# Altium schematic sheet Sheet3.SchDoc
size Tabloid; SheetNumber: 1; SheetTotal: 1
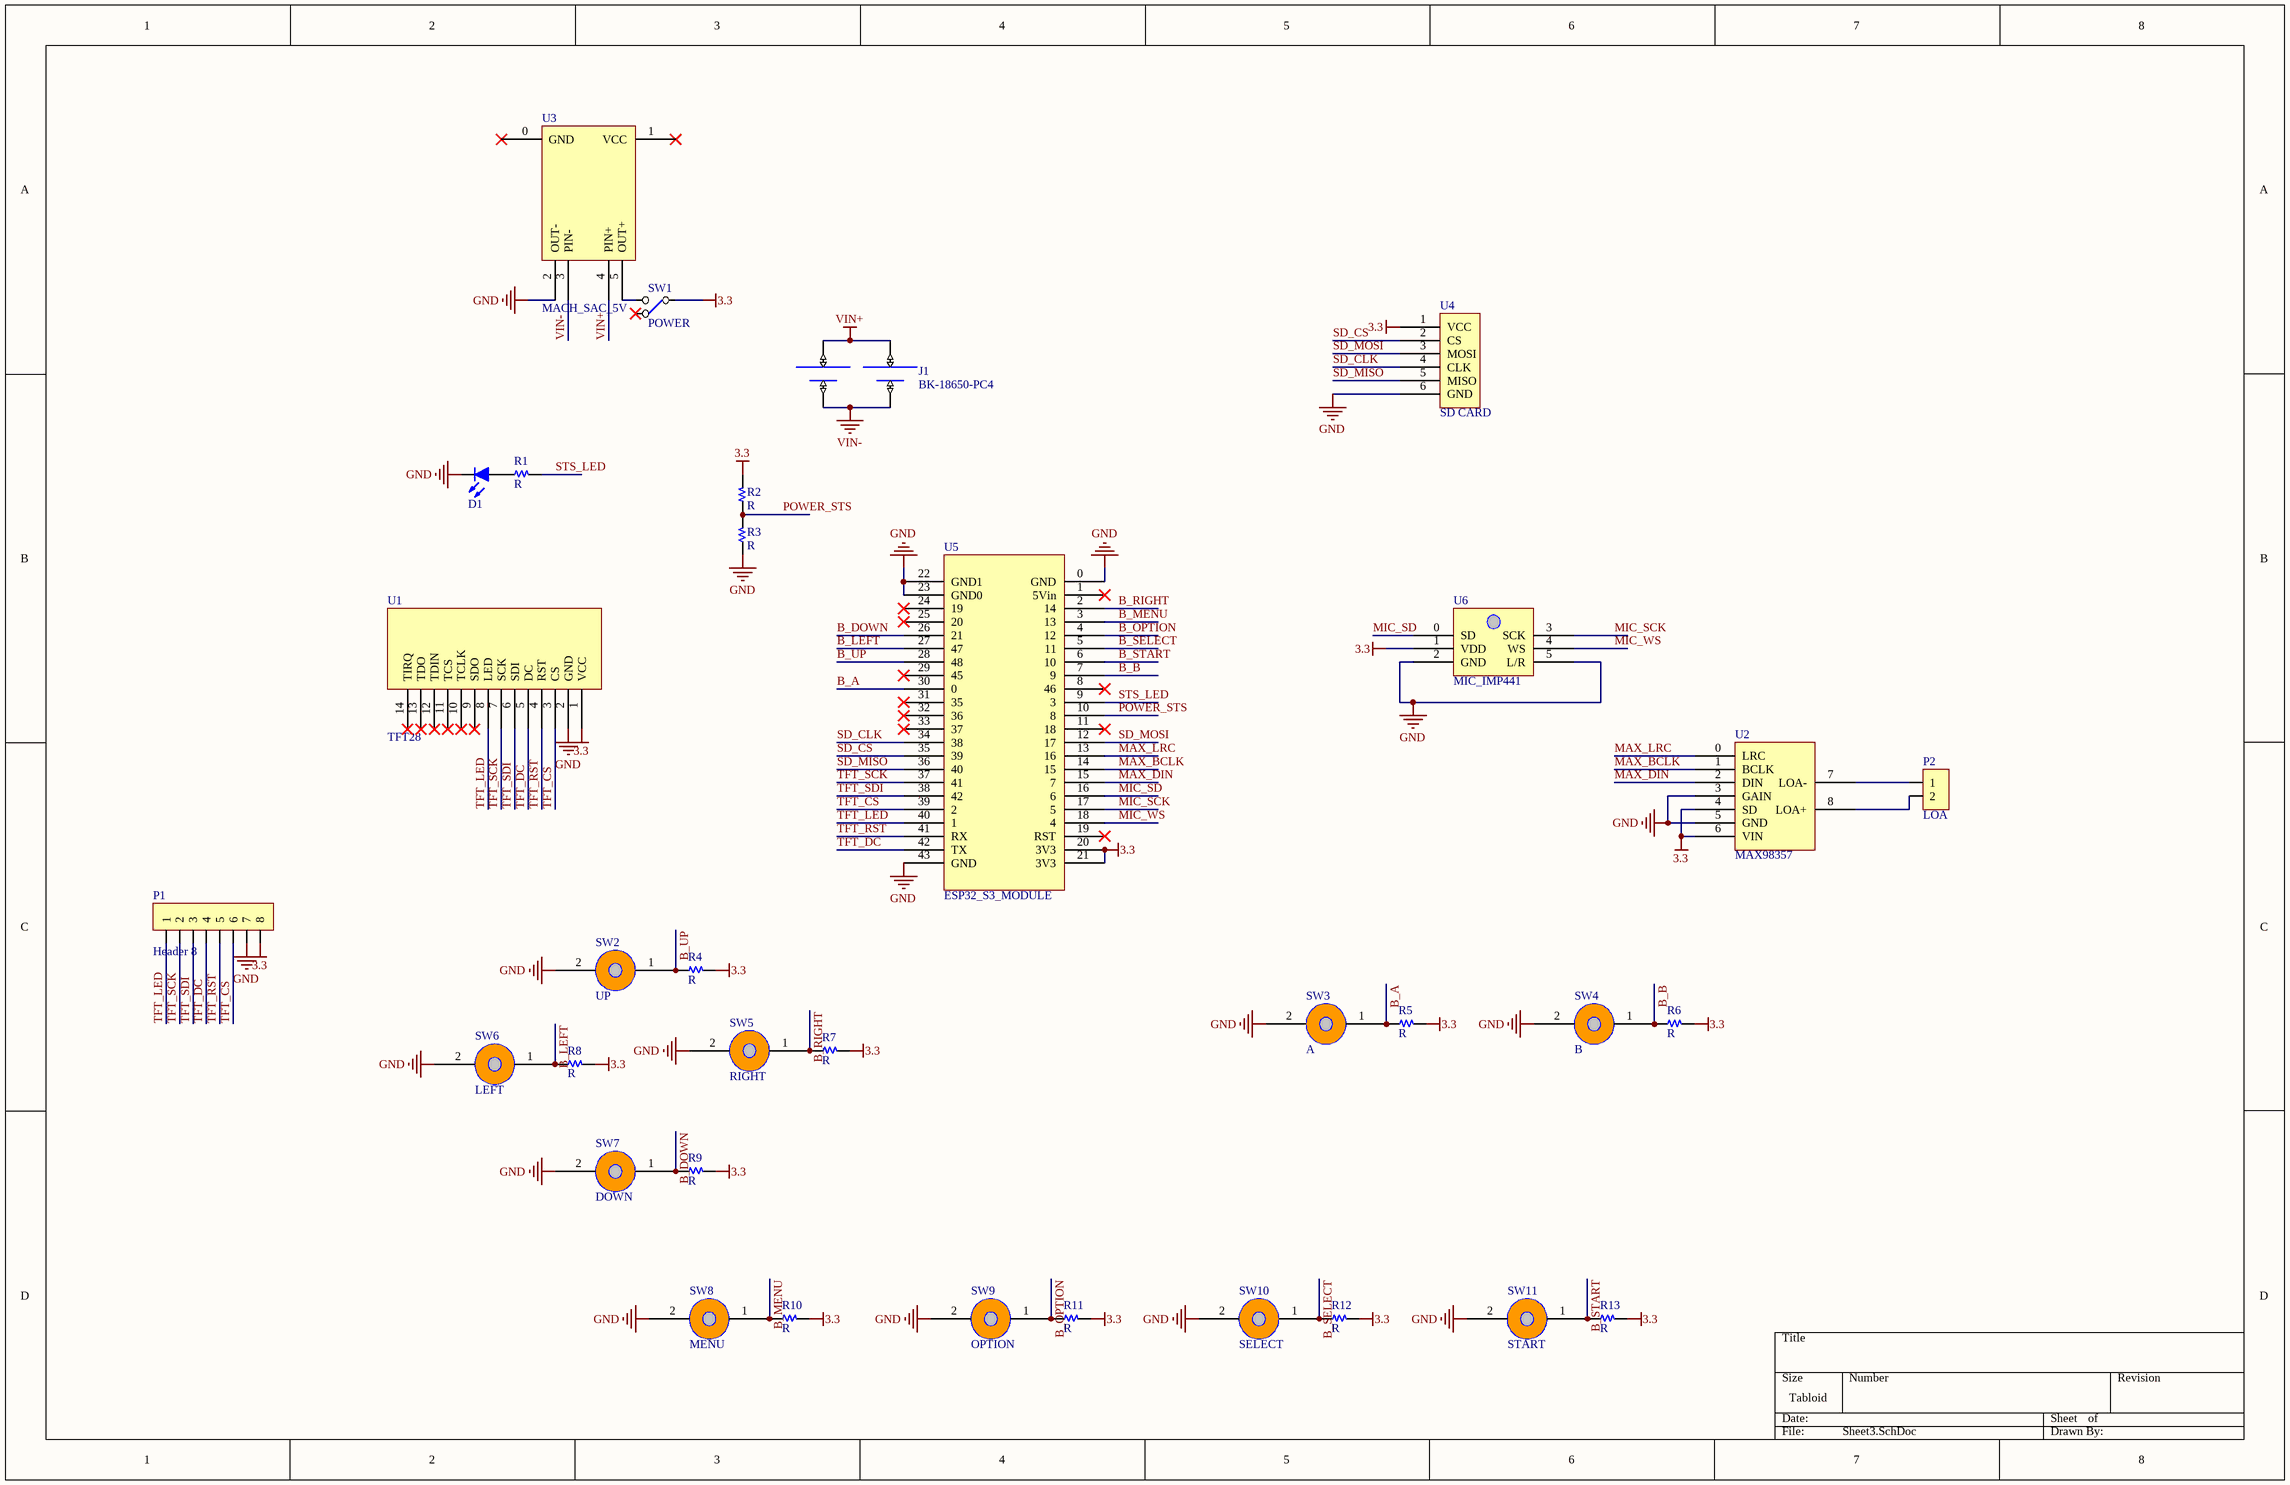
[diagram p0: Sheet3.SchDoc]

## Parts
D1  Led  [LED 5MM - GREEN]  (value not drawn)
J1  BK-18650-PC4  [18650-PC4]
P1  Header 8  [HDR/Header/8]
P2  LOA  [HDR/Header/2/BOX]
R1  R  [R 0805]
R2  R  [R 0805]
R3  R  [R 0805]
R4  R  [R 0805]
R5  R  [R 0805]
R6  R  [R 0805]
R7  R  [R 0805]
R8  R  [R 0805]
R9  R  [R 0805]
R10  R  [R 0805]
R11  R  [R 0805]
R12  R  [R 0805]
R13  R  [R 0805]
SW1  POWER  [SW/3/SPDT/SS12D10]
SW2  UP  [Button2Psilicon]
SW3  A  [Button2Psilicon]
SW4  B  [Button2Psilicon]
SW5  RIGHT  [Button2Psilicon]
SW6  LEFT  [Button2Psilicon]
SW7  DOWN  [Button2Psilicon]
SW8  MENU  [Button2Psilicon]
SW9  OPTION  [Button2Psilicon]
SW10  SELECT  [Button2Psilicon]
SW11  START  [Button2Psilicon]
U1  TFT28  [TFT - duplicate]
U2  MAX98357  [MAX98357]
U3  MACH_SAC_5V  [TP4056]
U4  SD CARD  [SDCARD_MODULE]
U5  ESP32_S3_MODULE  [ESP32_S3_MODULE]
U6  MIC_IMP441  [IMP441]

## Nets
3.3: P1.8 R2.2 R4.2 R5.2 R6.2 R7.2 R8.2 R9.2 R10.2 R11.2 R12.2 R13.2 SW1.2(COMMON1) U1.1(VCC) U2.4(SD) U2.6(VIN) U4.1(VCC) U5.20(3V3) U5.21(3V3) U6.1(VDD)
GND: D1.2(K) P1.7 R3.1 SW2.2 SW3.2 SW4.2 SW5.2 SW6.2 SW7.2 SW8.2 SW9.2 SW10.2 SW11.2 U1.2(GND) U2.3(GAIN) U2.5(GND) U3.2(OUT-) U4.6(GND) U5.0(GND) U5.22(GND1) U5.23(GND0) U5.43(GND) U6.2(GND) U6.5(L/R)
VIN+: J1.+1 J1.+2 U3.4(PIN+)
VIN-: J1.-1 J1.-2 U3.3(PIN-)
B_A: R5.1 SW3.1 U5.30(0)
B_B: R6.1 SW4.1 U5.7(9)
B_DOWN: R9.1 SW7.1 U5.26(21)
B_LEFT: R8.1 SW6.1 U5.27(47)
B_MENU: R10.1 SW8.1 U5.3(13)
B_OPTION: R11.1 SW9.1 U5.4(12)
B_RIGHT: R7.1 SW5.1 U5.2(14)
B_SELECT: R12.1 SW10.1 U5.5(11)
B_START: R13.1 SW11.1 U5.6(10)
B_UP: R4.1 SW2.1 U5.28(48)
MAX_BCLK: U2.1(BCLK) U5.14(15)
MAX_DIN: U2.2(DIN) U5.15(7)
MAX_LRC: U2.0(LRC) U5.13(16)
MIC_SCK: U5.17(5) U6.3(SCK)
MIC_SD: U5.16(6) U6.0(SD)
MIC_WS: U5.18(4) U6.4(WS)
POWER_STS: R2.1 R3.2 U5.10(8)
SD_CLK: U4.4(CLK) U5.34(38)
SD_CS: U4.2(CS) U5.35(39)
SD_MISO: U4.5(MISO) U5.36(40)
SD_MOSI: U4.3(MOSI) U5.12(17)
STS_LED: R1.2 U5.9(3)
TFT_CS: P1.6 U1.3(CS) U5.39(2)
TFT_DC: P1.4 U1.5(DC) U5.42(TX)
TFT_LED: P1.1 U1.8(LED) U5.40(1)
TFT_RST: P1.5 U1.4(RST) U5.41(RX)
TFT_SCK: P1.2 U1.7(SCK) U5.37(41)
TFT_SDI: P1.3 U1.6(SDI) U5.38(42)
NetD1_1: D1.1(A) R1.1
NetP2_1: P2.1 U2.7(LOA-)
NetP2_2: P2.2 U2.8(LOA+)
NetSW1_3: SW1.3(NO1) U3.5(OUT+)

Not connected (* = marked no-connect by the designer): SW1 1(NC1)*; U1 9(SDO)* 10(TCLK)* 11(TCS)* 12(TDIN)* 13(TDO)* 14(TIRQ)*; U3 0(GND)* 1(VCC)*; U5 1(5Vin)* 8(46)* 11(18)* 19(RST)* 24(19)* 25(20)* 29(45)* 31(35)* 32(36)* 33(37)*

## Library data of the parts
D1 = Led: Typical LED
J1 = BK-18650-PC4: Battery Holder (Open) 18650 2 Cell PC Pin; MF: MPD (Memory Protection Devices); SnapEDA_Link: https://www.snapeda.com/parts/BK-18650-PC4/Memory+Protection+Devices/view-part/?ref=snap; Package: None; Value: *; MP: BK-18650-PC4; Check_prices: https://www.snapeda.com/parts/BK-18650-PC4/Memory+Protection+Devices/view-part/?ref=eda
P1 = Header 8: Header, 8-Pin
P2 = Header 2: Header, 2-Pin
R1-R13 = Resistor
SW1 = SW SPDT
SW2-SW11 = Silicone 2P button SMD
U4 = SD Card Module